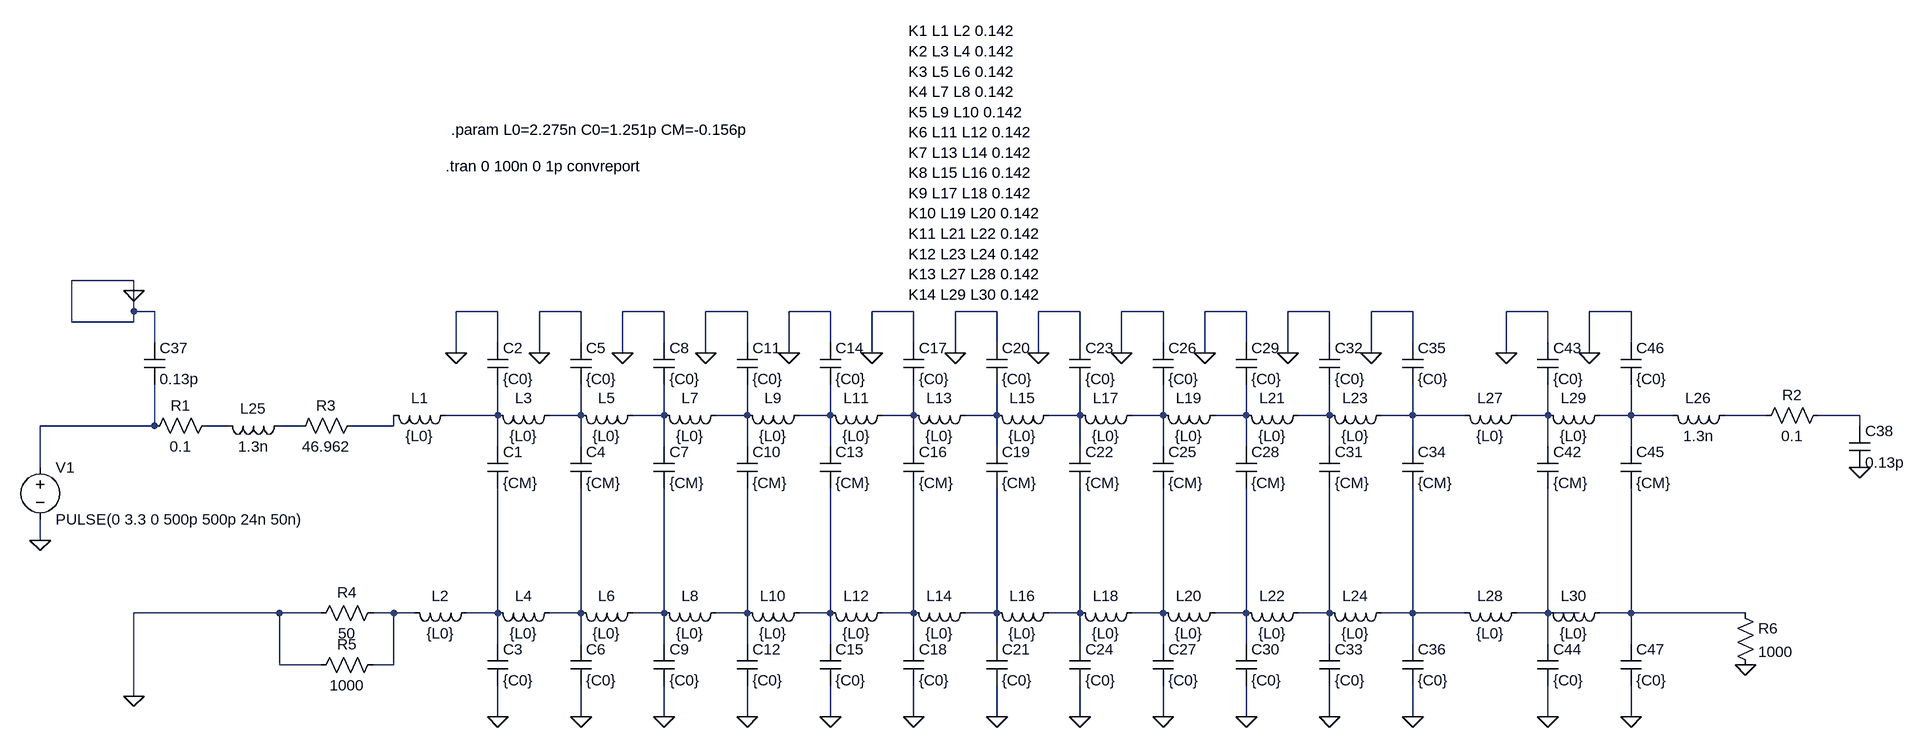
[diagram p0: schematic Assignment1_Side_by_side.asc]
Assignment1_Side_by_side.asc, the LTspice schematic file:
Version 4.1
SHEET 1 1868 772
WIRE -864 80 -960 80
WIRE -864 96 -864 80
WIRE -864 128 -864 96
WIRE -832 128 -864 128
WIRE -304 128 -368 128
WIRE -176 128 -240 128
WIRE -48 128 -112 128
WIRE 80 128 16 128
WIRE 208 128 144 128
WIRE 336 128 272 128
WIRE 464 128 400 128
WIRE 592 128 528 128
WIRE 720 128 656 128
WIRE 848 128 784 128
WIRE 976 128 912 128
WIRE 1104 128 1040 128
WIRE 1312 128 1248 128
WIRE 1440 128 1376 128
WIRE -960 144 -960 80
WIRE -864 144 -864 128
WIRE -864 144 -960 144
WIRE -832 176 -832 128
WIRE -304 176 -304 128
WIRE -176 176 -176 128
WIRE -48 176 -48 128
WIRE 80 176 80 128
WIRE 208 176 208 128
WIRE 336 176 336 128
WIRE 464 176 464 128
WIRE 592 176 592 128
WIRE 720 176 720 128
WIRE 848 176 848 128
WIRE 976 176 976 128
WIRE 1104 176 1104 128
WIRE 1312 176 1312 128
WIRE 1440 176 1440 128
WIRE -368 192 -368 128
WIRE -240 192 -240 128
WIRE -112 192 -112 128
WIRE 16 192 16 128
WIRE 144 192 144 128
WIRE 272 192 272 128
WIRE 400 192 400 128
WIRE 528 192 528 128
WIRE 656 192 656 128
WIRE 784 192 784 128
WIRE 912 192 912 128
WIRE 1040 192 1040 128
WIRE 1248 192 1248 128
WIRE 1376 192 1376 128
WIRE -304 288 -304 240
WIRE -304 288 -384 288
WIRE -176 288 -176 240
WIRE -176 288 -224 288
WIRE -48 288 -48 240
WIRE -48 288 -96 288
WIRE 80 288 80 240
WIRE 80 288 32 288
WIRE 208 288 208 240
WIRE 208 288 160 288
WIRE 336 288 336 240
WIRE 336 288 288 288
WIRE 464 288 464 240
WIRE 464 288 416 288
WIRE 592 288 592 240
WIRE 592 288 544 288
WIRE 720 288 720 240
WIRE 720 288 672 288
WIRE 848 288 848 240
WIRE 848 288 800 288
WIRE 976 288 976 240
WIRE 976 288 928 288
WIRE 1104 288 1104 240
WIRE 1104 288 1056 288
WIRE 1184 288 1104 288
WIRE 1312 288 1312 240
WIRE 1312 288 1264 288
WIRE 1440 288 1440 240
WIRE 1440 288 1392 288
WIRE 1504 288 1440 288
WIRE 1648 288 1584 288
WIRE 1792 288 1728 288
WIRE -832 304 -832 240
WIRE -832 304 -1008 304
WIRE -720 304 -752 304
WIRE -608 304 -640 304
WIRE -464 304 -464 288
WIRE -464 304 -528 304
WIRE 1792 304 1792 288
WIRE -304 336 -304 288
WIRE -176 336 -176 288
WIRE -48 336 -48 288
WIRE 80 336 80 288
WIRE 208 336 208 288
WIRE 336 336 336 288
WIRE 464 336 464 288
WIRE 592 336 592 288
WIRE 720 336 720 288
WIRE 848 336 848 288
WIRE 976 336 976 288
WIRE 1104 336 1104 288
WIRE 1312 336 1312 288
WIRE 1440 336 1440 288
WIRE -1008 368 -1008 304
WIRE -1008 480 -1008 448
WIRE -640 592 -864 592
WIRE -576 592 -640 592
WIRE -464 592 -496 592
WIRE -432 592 -464 592
WIRE -304 592 -304 400
WIRE -304 592 -352 592
WIRE -176 592 -176 400
WIRE -176 592 -224 592
WIRE -48 592 -48 400
WIRE -48 592 -96 592
WIRE 80 592 80 400
WIRE 80 592 32 592
WIRE 208 592 208 400
WIRE 208 592 160 592
WIRE 336 592 336 400
WIRE 336 592 288 592
WIRE 464 592 464 400
WIRE 464 592 416 592
WIRE 592 592 592 400
WIRE 592 592 544 592
WIRE 720 592 720 400
WIRE 720 592 672 592
WIRE 848 592 848 400
WIRE 848 592 800 592
WIRE 976 592 976 400
WIRE 976 592 928 592
WIRE 1104 592 1104 400
WIRE 1104 592 1056 592
WIRE 1184 592 1104 592
WIRE 1312 592 1312 400
WIRE 1312 592 1264 592
WIRE 1360 592 1312 592
WIRE 1440 592 1440 400
WIRE 1440 592 1392 592
WIRE 1616 592 1440 592
WIRE -304 640 -304 592
WIRE -176 640 -176 592
WIRE -48 640 -48 592
WIRE 80 640 80 592
WIRE 208 640 208 592
WIRE 336 640 336 592
WIRE 464 640 464 592
WIRE 592 640 592 592
WIRE 720 640 720 592
WIRE 848 640 848 592
WIRE 976 640 976 592
WIRE 1104 640 1104 592
WIRE 1312 640 1312 592
WIRE 1440 640 1440 592
WIRE -640 672 -640 592
WIRE -576 672 -640 672
WIRE -464 672 -464 592
WIRE -464 672 -496 672
WIRE -864 720 -864 592
WIRE -304 752 -304 704
WIRE -176 752 -176 704
WIRE -48 752 -48 704
WIRE 80 752 80 704
WIRE 208 752 208 704
WIRE 336 752 336 704
WIRE 464 752 464 704
WIRE 592 752 592 704
WIRE 720 752 720 704
WIRE 848 752 848 704
WIRE 976 752 976 704
WIRE 1104 752 1104 704
WIRE 1312 752 1312 704
WIRE 1440 752 1440 704
FLAG -1008 480 0
FLAG -368 192 0
FLAG -304 752 0
FLAG -240 192 0
FLAG -176 752 0
FLAG -112 192 0
FLAG -48 752 0
FLAG 16 192 0
FLAG 80 752 0
FLAG 144 192 0
FLAG 208 752 0
FLAG 272 192 0
FLAG 336 752 0
FLAG 400 192 0
FLAG 464 752 0
FLAG 528 192 0
FLAG 592 752 0
FLAG 656 192 0
FLAG 720 752 0
FLAG 784 192 0
FLAG 848 752 0
FLAG 912 192 0
FLAG 976 752 0
FLAG 1040 192 0
FLAG 1104 752 0
FLAG -864 96 0
FLAG 1792 368 0
FLAG -864 720 0
FLAG 1616 672 0
FLAG 1248 192 0
FLAG 1312 752 0
FLAG 1376 192 0
FLAG 1440 752 0
SYMBOL voltage -1008 352 R0
WINDOW 123 0 0 Left 0
WINDOW 39 0 0 Left 0
SYMATTR InstName V1
SYMATTR Value PULSE(0 3.3 0 500p 500p 24n 50n)
SYMBOL res -736 288 R90
WINDOW 0 0 56 VBottom 2
WINDOW 3 32 56 VTop 2
SYMATTR InstName R1
SYMATTR Value 0.1
SYMBOL ind -368 272 R90
WINDOW 0 5 56 VBottom 2
WINDOW 3 32 56 VTop 2
SYMATTR InstName L1
SYMATTR Value {L0}
SYMATTR Type ind
SYMATTR SpiceLine Rser=1m
SYMBOL cap -320 336 R0
SYMATTR InstName C1
SYMATTR Value {CM}
SYMBOL cap -320 176 R0
SYMATTR InstName C2
SYMATTR Value {C0}
SYMBOL ind -336 576 R90
WINDOW 0 5 56 VBottom 2
WINDOW 3 32 56 VTop 2
SYMATTR InstName L2
SYMATTR Value {L0}
SYMATTR Type ind
SYMATTR SpiceLine Rser=1m
SYMBOL cap -320 640 R0
SYMATTR InstName C3
SYMATTR Value {C0}
SYMBOL ind -208 272 R90
WINDOW 0 5 56 VBottom 2
WINDOW 3 32 56 VTop 2
SYMATTR InstName L3
SYMATTR Value {L0}
SYMATTR Type ind
SYMATTR SpiceLine Rser=1m
SYMBOL cap -192 336 R0
SYMATTR InstName C4
SYMATTR Value {CM}
SYMBOL cap -192 176 R0
SYMATTR InstName C5
SYMATTR Value {C0}
SYMBOL ind -208 576 R90
WINDOW 0 5 56 VBottom 2
WINDOW 3 32 56 VTop 2
SYMATTR InstName L4
SYMATTR Value {L0}
SYMATTR Type ind
SYMATTR SpiceLine Rser=1m
SYMBOL cap -192 640 R0
SYMATTR InstName C6
SYMATTR Value {C0}
SYMBOL ind -80 272 R90
WINDOW 0 5 56 VBottom 2
WINDOW 3 32 56 VTop 2
SYMATTR InstName L5
SYMATTR Value {L0}
SYMATTR Type ind
SYMATTR SpiceLine Rser=1m
SYMBOL cap -64 336 R0
SYMATTR InstName C7
SYMATTR Value {CM}
SYMBOL cap -64 176 R0
SYMATTR InstName C8
SYMATTR Value {C0}
SYMBOL ind -80 576 R90
WINDOW 0 5 56 VBottom 2
WINDOW 3 32 56 VTop 2
SYMATTR InstName L6
SYMATTR Value {L0}
SYMATTR Type ind
SYMATTR SpiceLine Rser=1m
SYMBOL cap -64 640 R0
SYMATTR InstName C9
SYMATTR Value {C0}
SYMBOL ind 48 272 R90
WINDOW 0 5 56 VBottom 2
WINDOW 3 32 56 VTop 2
SYMATTR InstName L7
SYMATTR Value {L0}
SYMATTR Type ind
SYMATTR SpiceLine Rser=1m
SYMBOL cap 64 336 R0
SYMATTR InstName C10
SYMATTR Value {CM}
SYMBOL cap 64 176 R0
SYMATTR InstName C11
SYMATTR Value {C0}
SYMBOL ind 48 576 R90
WINDOW 0 5 56 VBottom 2
WINDOW 3 32 56 VTop 2
SYMATTR InstName L8
SYMATTR Value {L0}
SYMATTR Type ind
SYMATTR SpiceLine Rser=1m
SYMBOL cap 64 640 R0
SYMATTR InstName C12
SYMATTR Value {C0}
SYMBOL ind 176 272 R90
WINDOW 0 5 56 VBottom 2
WINDOW 3 32 56 VTop 2
SYMATTR InstName L9
SYMATTR Value {L0}
SYMATTR Type ind
SYMATTR SpiceLine Rser=1m
SYMBOL cap 192 336 R0
SYMATTR InstName C13
SYMATTR Value {CM}
SYMBOL cap 192 176 R0
SYMATTR InstName C14
SYMATTR Value {C0}
SYMBOL ind 176 576 R90
WINDOW 0 5 56 VBottom 2
WINDOW 3 32 56 VTop 2
SYMATTR InstName L10
SYMATTR Value {L0}
SYMATTR Type ind
SYMATTR SpiceLine Rser=1m
SYMBOL cap 192 640 R0
SYMATTR InstName C15
SYMATTR Value {C0}
SYMBOL ind 304 272 R90
WINDOW 0 5 56 VBottom 2
WINDOW 3 32 56 VTop 2
SYMATTR InstName L11
SYMATTR Value {L0}
SYMATTR Type ind
SYMATTR SpiceLine Rser=1m
SYMBOL cap 320 336 R0
SYMATTR InstName C16
SYMATTR Value {CM}
SYMBOL cap 320 176 R0
SYMATTR InstName C17
SYMATTR Value {C0}
SYMBOL ind 304 576 R90
WINDOW 0 5 56 VBottom 2
WINDOW 3 32 56 VTop 2
SYMATTR InstName L12
SYMATTR Value {L0}
SYMATTR Type ind
SYMATTR SpiceLine Rser=1m
SYMBOL cap 320 640 R0
SYMATTR InstName C18
SYMATTR Value {C0}
SYMBOL ind 432 272 R90
WINDOW 0 5 56 VBottom 2
WINDOW 3 32 56 VTop 2
SYMATTR InstName L13
SYMATTR Value {L0}
SYMATTR Type ind
SYMATTR SpiceLine Rser=1m
SYMBOL cap 448 336 R0
SYMATTR InstName C19
SYMATTR Value {CM}
SYMBOL cap 448 176 R0
SYMATTR InstName C20
SYMATTR Value {C0}
SYMBOL ind 432 576 R90
WINDOW 0 5 56 VBottom 2
WINDOW 3 32 56 VTop 2
SYMATTR InstName L14
SYMATTR Value {L0}
SYMATTR Type ind
SYMATTR SpiceLine Rser=1m
SYMBOL cap 448 640 R0
SYMATTR InstName C21
SYMATTR Value {C0}
SYMBOL ind 560 272 R90
WINDOW 0 5 56 VBottom 2
WINDOW 3 32 56 VTop 2
SYMATTR InstName L15
SYMATTR Value {L0}
SYMATTR Type ind
SYMATTR SpiceLine Rser=1m
SYMBOL cap 576 336 R0
SYMATTR InstName C22
SYMATTR Value {CM}
SYMBOL cap 576 176 R0
SYMATTR InstName C23
SYMATTR Value {C0}
SYMBOL ind 560 576 R90
WINDOW 0 5 56 VBottom 2
WINDOW 3 32 56 VTop 2
SYMATTR InstName L16
SYMATTR Value {L0}
SYMATTR Type ind
SYMATTR SpiceLine Rser=1m
SYMBOL cap 576 640 R0
SYMATTR InstName C24
SYMATTR Value {C0}
SYMBOL ind 688 272 R90
WINDOW 0 5 56 VBottom 2
WINDOW 3 32 56 VTop 2
SYMATTR InstName L17
SYMATTR Value {L0}
SYMATTR Type ind
SYMATTR SpiceLine Rser=1m
SYMBOL cap 704 336 R0
SYMATTR InstName C25
SYMATTR Value {CM}
SYMBOL cap 704 176 R0
SYMATTR InstName C26
SYMATTR Value {C0}
SYMBOL ind 688 576 R90
WINDOW 0 5 56 VBottom 2
WINDOW 3 32 56 VTop 2
SYMATTR InstName L18
SYMATTR Value {L0}
SYMATTR Type ind
SYMATTR SpiceLine Rser=1m
SYMBOL cap 704 640 R0
SYMATTR InstName C27
SYMATTR Value {C0}
SYMBOL ind 816 272 R90
WINDOW 0 5 56 VBottom 2
WINDOW 3 32 56 VTop 2
SYMATTR InstName L19
SYMATTR Value {L0}
SYMATTR Type ind
SYMATTR SpiceLine Rser=1m
SYMBOL cap 832 336 R0
SYMATTR InstName C28
SYMATTR Value {CM}
SYMBOL cap 832 176 R0
SYMATTR InstName C29
SYMATTR Value {C0}
SYMBOL ind 816 576 R90
WINDOW 0 5 56 VBottom 2
WINDOW 3 32 56 VTop 2
SYMATTR InstName L20
SYMATTR Value {L0}
SYMATTR Type ind
SYMATTR SpiceLine Rser=1m
SYMBOL cap 832 640 R0
SYMATTR InstName C30
SYMATTR Value {C0}
SYMBOL ind 944 272 R90
WINDOW 0 5 56 VBottom 2
WINDOW 3 32 56 VTop 2
SYMATTR InstName L21
SYMATTR Value {L0}
SYMATTR Type ind
SYMATTR SpiceLine Rser=1m
SYMBOL cap 960 336 R0
SYMATTR InstName C31
SYMATTR Value {CM}
SYMBOL cap 960 176 R0
SYMATTR InstName C32
SYMATTR Value {C0}
SYMBOL ind 944 576 R90
WINDOW 0 5 56 VBottom 2
WINDOW 3 32 56 VTop 2
SYMATTR InstName L22
SYMATTR Value {L0}
SYMATTR Type ind
SYMATTR SpiceLine Rser=1m
SYMBOL cap 960 640 R0
SYMATTR InstName C33
SYMATTR Value {C0}
SYMBOL ind 1072 272 R90
WINDOW 0 5 56 VBottom 2
WINDOW 3 32 56 VTop 2
SYMATTR InstName L23
SYMATTR Value {L0}
SYMATTR Type ind
SYMATTR SpiceLine Rser=1m
SYMBOL cap 1088 336 R0
SYMATTR InstName C34
SYMATTR Value {CM}
SYMBOL cap 1088 176 R0
SYMATTR InstName C35
SYMATTR Value {C0}
SYMBOL ind 1072 576 R90
WINDOW 0 5 56 VBottom 2
WINDOW 3 32 56 VTop 2
SYMATTR InstName L24
SYMATTR Value {L0}
SYMATTR Type ind
SYMATTR SpiceLine Rser=1m
SYMBOL cap 1088 640 R0
SYMATTR InstName C36
SYMATTR Value {C0}
SYMBOL ind -624 288 R90
WINDOW 0 5 56 VBottom 2
WINDOW 3 32 56 VTop 2
SYMATTR InstName L25
SYMATTR Value 1.3n
SYMATTR SpiceLine Rser=0
SYMBOL cap -848 176 R0
SYMATTR InstName C37
SYMATTR Value 0.13p
SYMBOL ind 1600 272 R90
WINDOW 0 5 56 VBottom 2
WINDOW 3 32 56 VTop 2
SYMATTR InstName L26
SYMATTR Value 1.3n
SYMATTR SpiceLine Rser=0
SYMBOL res 1744 272 R90
WINDOW 0 0 56 VBottom 2
WINDOW 3 32 56 VTop 2
SYMATTR InstName R2
SYMATTR Value 0.1
SYMBOL cap 1776 304 R0
SYMATTR InstName C38
SYMATTR Value 0.13p
SYMBOL res -512 288 R90
WINDOW 0 0 56 VBottom 2
WINDOW 3 32 56 VTop 2
SYMATTR InstName R3
SYMATTR Value 46.962
SYMBOL res -480 576 R90
WINDOW 0 0 56 VBottom 2
WINDOW 3 32 56 VTop 2
SYMATTR InstName R4
SYMATTR Value 50
SYMBOL res -480 656 R90
WINDOW 0 0 56 VBottom 2
WINDOW 3 32 56 VTop 2
SYMATTR InstName R5
SYMATTR Value 1000
SYMBOL res 1600 576 R0
SYMATTR InstName R6
SYMATTR Value 1000
SYMBOL ind 1280 272 R90
WINDOW 0 5 56 VBottom 2
WINDOW 3 32 56 VTop 2
SYMATTR InstName L27
SYMATTR Value {L0}
SYMATTR Type ind
SYMATTR SpiceLine Rser=1m
SYMBOL cap 1296 336 R0
SYMATTR InstName C42
SYMATTR Value {CM}
SYMBOL cap 1296 176 R0
SYMATTR InstName C43
SYMATTR Value {C0}
SYMBOL ind 1280 576 R90
WINDOW 0 5 56 VBottom 2
WINDOW 3 32 56 VTop 2
SYMATTR InstName L28
SYMATTR Value {L0}
SYMATTR Type ind
SYMATTR SpiceLine Rser=1m
SYMBOL cap 1296 640 R0
SYMATTR InstName C44
SYMATTR Value {C0}
SYMBOL ind 1408 272 R90
WINDOW 0 5 56 VBottom 2
WINDOW 3 32 56 VTop 2
SYMATTR InstName L29
SYMATTR Value {L0}
SYMATTR Type ind
SYMATTR SpiceLine Rser=1m
SYMBOL cap 1424 336 R0
SYMATTR InstName C45
SYMATTR Value {CM}
SYMBOL cap 1424 176 R0
SYMATTR InstName C46
SYMATTR Value {C0}
SYMBOL ind 1408 576 R90
WINDOW 0 5 56 VBottom 2
WINDOW 3 32 56 VTop 2
SYMATTR InstName L30
SYMATTR Value {L0}
SYMATTR Type ind
SYMATTR SpiceLine Rser=1m
SYMBOL cap 1424 640 R0
SYMATTR InstName C47
SYMATTR Value {C0}
TEXT -376 -152 Left 2 !.param L0=2.275n C0=1.251p CM=-0.156p
TEXT -384 -96 Left 2 !.tran 0 100n 0 1p convreport
TEXT 328 -304 Left 2 !K1 L1 L2 0.142\nK2 L3 L4 0.142\nK3 L5 L6 0.142\nK4 L7 L8 0.142\nK5 L9 L10 0.142\nK6 L11 L12 0.142\nK7 L13 L14 0.142\nK8 L15 L16 0.142\nK9 L17 L18 0.142\nK10 L19 L20 0.142\nK11 L21 L22 0.142\nK12 L23 L24 0.142\nK13 L27 L28 0.142\nK14 L29 L30 0.142

The netlist it stands for:
* Assignment1_Side_by_side.asc
V1 N017 0 PULSE(0 3.3 0 500p 500p 24n 50n)
R1 N018 N017 0.1
L1 N001 N020 {L0} Rser=1m
C1 N001 N022 {CM}
C2 0 N001 {C0}
L2 N022 N021 {L0} Rser=1m
C3 N022 0 {C0}
L3 N002 N001 {L0} Rser=1m
C4 N002 N023 {CM}
C5 0 N002 {C0}
L4 N023 N022 {L0} Rser=1m
C6 N023 0 {C0}
L5 N003 N002 {L0} Rser=1m
C7 N003 N024 {CM}
C8 0 N003 {C0}
L6 N024 N023 {L0} Rser=1m
C9 N024 0 {C0}
L7 N004 N003 {L0} Rser=1m
C10 N004 N025 {CM}
C11 0 N004 {C0}
L8 N025 N024 {L0} Rser=1m
C12 N025 0 {C0}
L9 N005 N004 {L0} Rser=1m
C13 N005 N026 {CM}
C14 0 N005 {C0}
L10 N026 N025 {L0} Rser=1m
C15 N026 0 {C0}
L11 N006 N005 {L0} Rser=1m
C16 N006 N027 {CM}
C17 0 N006 {C0}
L12 N027 N026 {L0} Rser=1m
C18 N027 0 {C0}
L13 N007 N006 {L0} Rser=1m
C19 N007 N028 {CM}
C20 0 N007 {C0}
L14 N028 N027 {L0} Rser=1m
C21 N028 0 {C0}
L15 N008 N007 {L0} Rser=1m
C22 N008 N029 {CM}
C23 0 N008 {C0}
L16 N029 N028 {L0} Rser=1m
C24 N029 0 {C0}
L17 N009 N008 {L0} Rser=1m
C25 N009 N030 {CM}
C26 0 N009 {C0}
L18 N030 N029 {L0} Rser=1m
C27 N030 0 {C0}
L19 N010 N009 {L0} Rser=1m
C28 N010 N031 {CM}
C29 0 N010 {C0}
L20 N031 N030 {L0} Rser=1m
C30 N031 0 {C0}
L21 N011 N010 {L0} Rser=1m
C31 N011 N032 {CM}
C32 0 N011 {C0}
L22 N032 N031 {L0} Rser=1m
C33 N032 0 {C0}
L23 N012 N011 {L0} Rser=1m
C34 N012 N033 {CM}
C35 0 N012 {C0}
L24 N033 N032 {L0} Rser=1m
C36 N033 0 {C0}
L25 N019 N018 1.3n Rser=0
C37 0 N017 0.13p
L26 N015 N014 1.3n Rser=0
R2 N016 N015 0.1
C38 N016 0 0.13p
R3 N020 N019 46.962
R4 N021 0 50
R5 N021 0 1000
R6 N035 0 1000
L27 N013 N012 {L0} Rser=1m
C42 N013 N034 {CM}
C43 0 N013 {C0}
L28 N034 N033 {L0} Rser=1m
C44 N034 0 {C0}
L29 N014 N013 {L0} Rser=1m
C45 N014 N035 {CM}
C46 0 N014 {C0}
L30 N035 N034 {L0} Rser=1m
C47 N035 0 {C0}
.param L0=2.275n C0=1.251p CM=-0.156p
.tran 0 100n 0 1p convreport
K1 L1 L2 0.142
K2 L3 L4 0.142
K3 L5 L6 0.142
K4 L7 L8 0.142
K5 L9 L10 0.142
K6 L11 L12 0.142
K7 L13 L14 0.142
K8 L15 L16 0.142
K9 L17 L18 0.142
K10 L19 L20 0.142
K11 L21 L22 0.142
K12 L23 L24 0.142
K13 L27 L28 0.142
K14 L29 L30 0.142
.backanno
.end